# Altium schematic sheet Overview.SchDoc
size A4; SheetNumber: 1; SheetTotal: 8
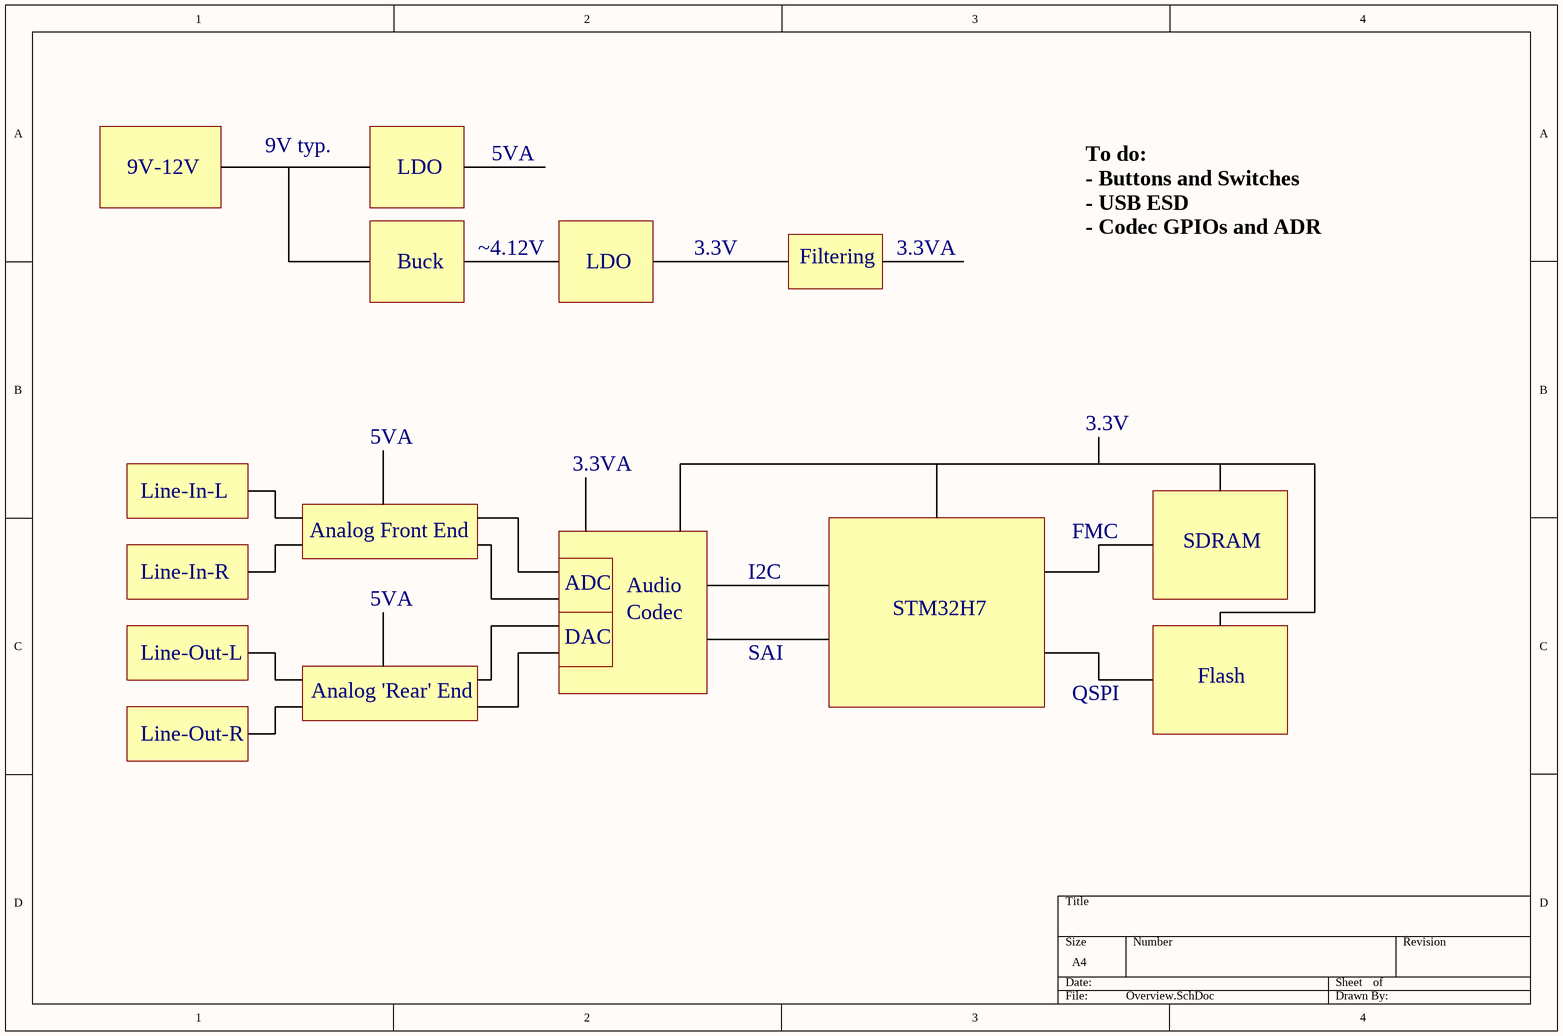
[diagram p0: Overview.SchDoc]

## Notes on the sheet
- 9V-12V
- 9V typ.
- LDO
- 5VA
- Buck
- ~4.12V
- 3.3V
- Filtering
- 3.3VA
- To do:
  - Buttons and Switches
  - USB ESD
  - Codec GPIOs and ADR
- Line-In-L
- Line-In-R
- Analog Front End
- I2C
- FMC
- SDRAM
- ADC
- DAC
- Audio
- Codec
- STM32H7
- Line-Out-L
- Analog 'Rear' End
- SAI
- QSPI
- Flash
- Line-Out-R